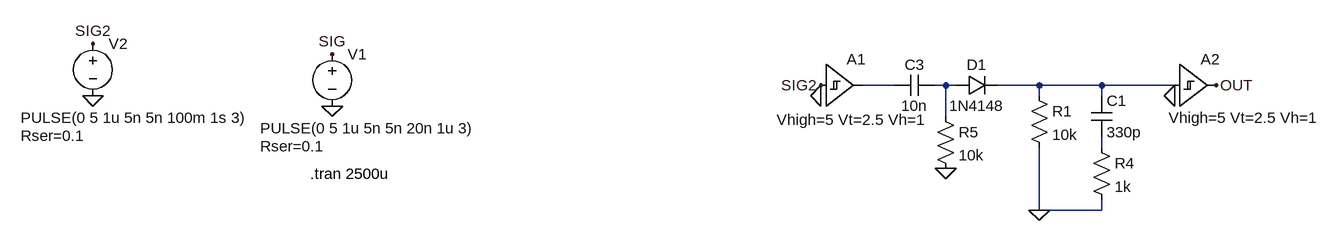
[diagram p0: schematic pulse_extend_width.asc]
pulse_extend_width.asc, the LTspice schematic file:
Version 4
SHEET 1 880 680
WIRE 208 112 160 112
WIRE 288 112 272 112
WIRE 304 112 288 112
WIRE 432 112 368 112
WIRE 528 112 432 112
WIRE 640 112 528 112
WIRE 432 128 432 112
WIRE 528 128 528 112
WIRE 288 160 288 112
WIRE 528 208 528 192
WIRE 432 304 432 208
WIRE 528 304 528 288
WIRE 528 304 432 304
FLAG -656 144 0
FLAG -656 64 SIG
FLAG 96 112 SIG2
FLAG 704 112 OUT
FLAG 432 304 0
FLAG 96 128 0
FLAG 640 128 0
FLAG -1024 128 0
FLAG -1024 48 SIG2
FLAG 288 240 0
SYMBOL Digital\\schmtbuf 96 48 R0
WINDOW 3 -68 117 Left 2
SYMATTR InstName A1
SYMATTR Value Vhigh=5 Vt=2.5 Vh=1
SYMBOL Digital\\schmtbuf 640 48 R0
WINDOW 3 -9 114 Left 2
SYMATTR InstName A2
SYMATTR Value Vhigh=5 Vt=2.5 Vh=1
SYMBOL voltage -656 48 R0
WINDOW 3 -111 130 Left 2
WINDOW 123 0 0 Left 0
WINDOW 39 -111 158 Left 2
SYMATTR InstName V1
SYMATTR Value PULSE(0 5 1u 5n 5n 20n 1u 3)
SYMATTR SpiceLine Rser=0.1
SYMBOL res 416 112 R0
SYMATTR InstName R1
SYMATTR Value 10k
SYMBOL diode 304 128 R270
WINDOW 0 32 32 VTop 2
WINDOW 3 0 32 VBottom 2
SYMATTR InstName D1
SYMATTR Value 1N4148
SYMBOL cap 512 128 R0
SYMATTR InstName C1
SYMATTR Value 330p
SYMBOL voltage -1024 32 R0
WINDOW 3 -111 130 Left 2
WINDOW 123 0 0 Left 0
WINDOW 39 -111 158 Left 2
SYMATTR InstName V2
SYMATTR Value PULSE(0 5 1u 5n 5n 100m 1s 3)
SYMATTR SpiceLine Rser=0.1
SYMBOL cap 272 96 R90
WINDOW 0 0 32 VBottom 2
WINDOW 3 32 32 VTop 2
SYMATTR InstName C3
SYMATTR Value 10n
SYMBOL res 512 192 R0
SYMATTR InstName R4
SYMATTR Value 1k
SYMBOL res 272 144 R0
SYMATTR InstName R5
SYMATTR Value 10k
TEXT -690 248 Left 2 !.tran 2500u

The netlist it stands for:
* pulse_extend_width.asc
A1 SIG2 0 0 0 0 0 N001 0 SCHMITT Vhigh=5 Vt=2.5 Vh=1
A2 N003 0 0 0 0 0 OUT 0 SCHMITT Vhigh=5 Vt=2.5 Vh=1
V1 SIG 0 PULSE(0 5 1u 5n 5n 20n 1u 3) Rser=0.1
R1 N003 0 10k
D1 N002 N003 1N4148
C1 N003 N004 330p
V2 SIG2 0 PULSE(0 5 1u 5n 5n 100m 1s 3) Rser=0.1
C3 N002 N001 10n
R4 N004 0 1k
R5 N002 0 10k
.model D D
.lib standard.dio
.tran 2500u
.backanno
.end